# Altium schematic sheet mcu2.SchDoc
size A4; SheetNumber: 3; SheetTotal: 3
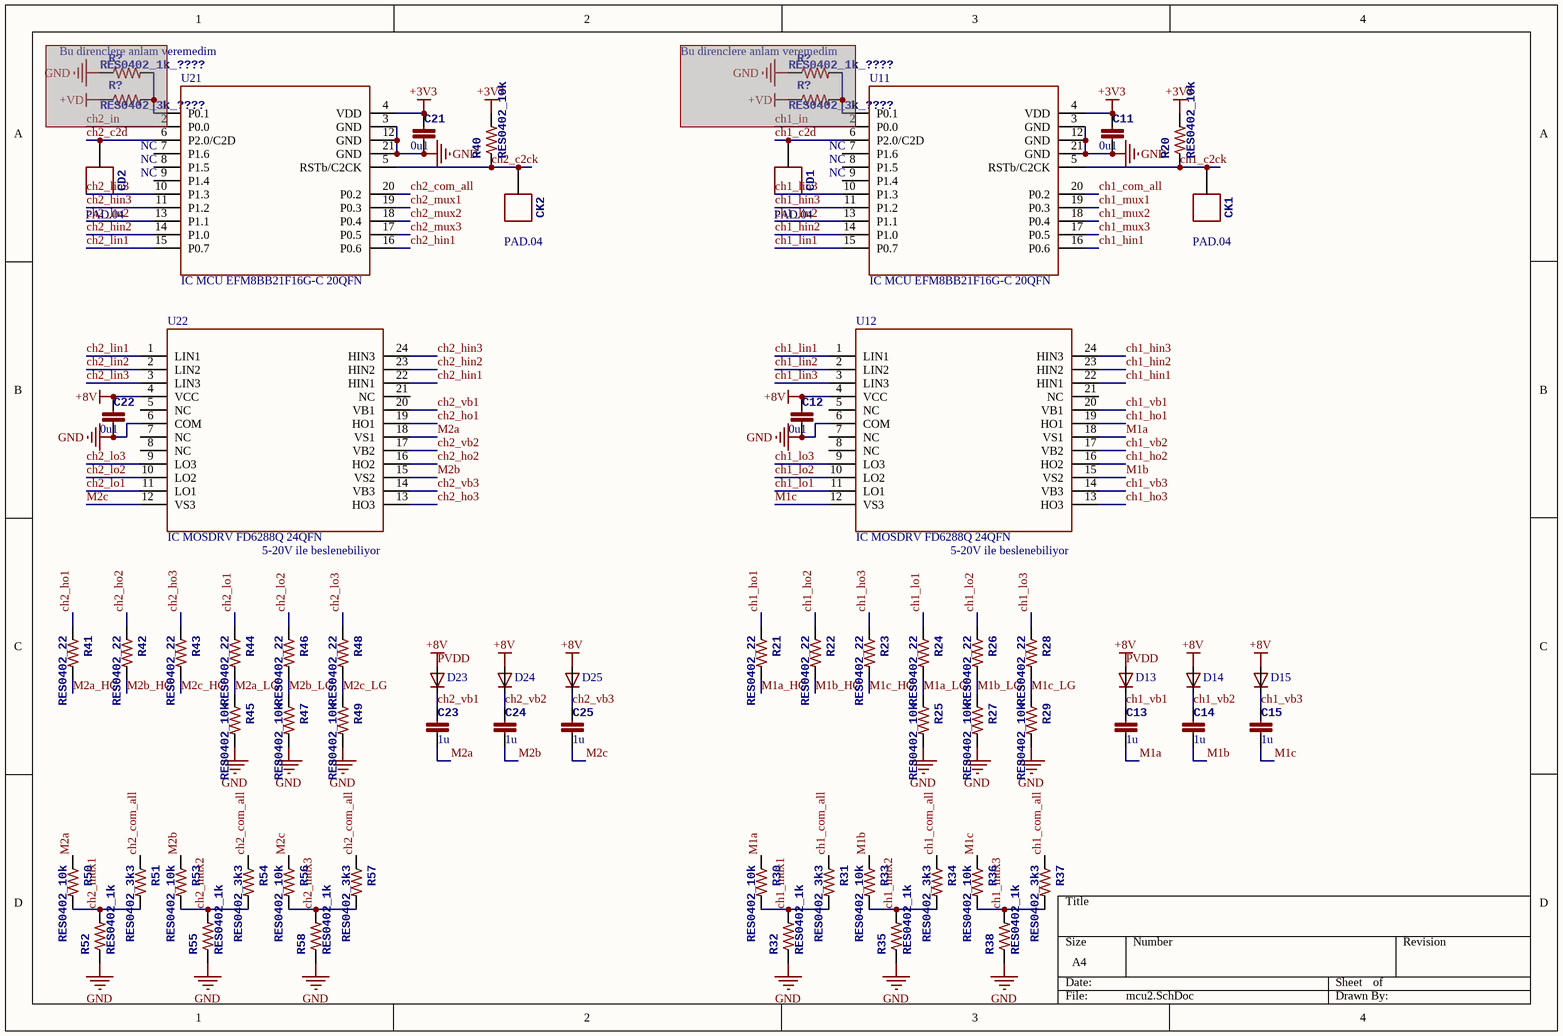
[diagram p0: mcu2.SchDoc]

## Parts
(Parts that share a designator on the sheet are numbered #1, #2 ... from top to bottom, then left to right.)
C11  value 0u1  [0402-CAP]  (hidden comment: CAP0402_0u1_16V_X7R)
C12  value 0u1  [0402-CAP]  (hidden comment: CAP0402_0u1_16V_X7R)
C13  value 1u  [0402-CAP]  (hidden comment: CAP0402_1u_16V_X5R)
C14  value 1u  [0402-CAP]  (hidden comment: CAP0402_1u_16V_X5R)
C15  value 1u  [0402-CAP]  (hidden comment: CAP0402_1u_16V_X5R)
C21  value 0u1  [0402-CAP]  (hidden comment: CAP0402_0u1_16V_X7R)
C22  value 0u1  [0402-CAP]  (hidden comment: CAP0402_0u1_16V_X7R)
C23  value 1u  [0402-CAP]  (hidden comment: CAP0402_1u_16V_X5R)
C24  value 1u  [0402-CAP]  (hidden comment: CAP0402_1u_16V_X5R)
C25  value 1u  [0402-CAP]  (hidden comment: CAP0402_1u_16V_X5R)
CD1  PAD.04  [PAD.04X.04]  (no BOM)
CD2  PAD.04  [PAD.04X.04]  (no BOM)
CK1  PAD.04  [PAD.04X.04]  (no BOM)
CK2  PAD.04  [PAD.04X.04]  (no BOM)
D13  DPWR_1N4148WT  [SOD-523_0P9X1P3]  (value not drawn)
D14  DPWR_1N4148WT  [SOD-523_0P9X1P3]  (value not drawn)
D15  DPWR_1N4148WT  [SOD-523_0P9X1P3]  (value not drawn)
D23  DPWR_1N4148WT  [SOD-523_0P9X1P3]  (value not drawn)
D24  DPWR_1N4148WT  [SOD-523_0P9X1P3]  (value not drawn)
D25  DPWR_1N4148WT  [SOD-523_0P9X1P3]  (value not drawn)
R20  RES0402_10k  [0402-RES]
R21  RES0402_22  [0402-RES]
R22  RES0402_22  [0402-RES]
R23  RES0402_22  [0402-RES]
R24  RES0402_22  [0402-RES]
R25  RES0402_10k  [0402-RES]
R26  RES0402_22  [0402-RES]
R27  RES0402_10k  [0402-RES]
R28  RES0402_22  [0402-RES]
R29  RES0402_10k  [0402-RES]
R30  RES0402_10k  [0402-RES]
R31  RES0402_3k3  [0402-RES]
R32  RES0402_1k  [0402-RES]
R33  RES0402_10k  [0402-RES]
R34  RES0402_3k3  [0402-RES]
R35  RES0402_1k  [0402-RES]
R36  RES0402_10k  [0402-RES]
R37  RES0402_3k3  [0402-RES]
R38  RES0402_1k  [0402-RES]
R40  RES0402_10k  [0402-RES]
R41  RES0402_22  [0402-RES]
R42  RES0402_22  [0402-RES]
R43  RES0402_22  [0402-RES]
R44  RES0402_22  [0402-RES]
R45  RES0402_10k  [0402-RES]
R46  RES0402_22  [0402-RES]
R47  RES0402_10k  [0402-RES]
R48  RES0402_22  [0402-RES]
R49  RES0402_10k  [0402-RES]
R50  RES0402_10k  [0402-RES]
R51  RES0402_3k3  [0402-RES]
R52  RES0402_1k  [0402-RES]
R53  RES0402_10k  [0402-RES]
R54  RES0402_3k3  [0402-RES]
R55  RES0402_1k  [0402-RES]
R56  RES0402_10k  [0402-RES]
R57  RES0402_3k3  [0402-RES]
R58  RES0402_1k  [0402-RES]
R?#1  RES0402_1k_????  [0402-RES]  (masked out: inside a compile mask, not in the netlist)
R?#2  RES0402_1k_????  [0402-RES]  (masked out: inside a compile mask, not in the netlist)
R?#3  RES0402_3k_????  [0402-RES]  (masked out: inside a compile mask, not in the netlist)
R?#4  RES0402_3k_????  [0402-RES]  (masked out: inside a compile mask, not in the netlist)
U11  IC MCU EFM8BB21F16G-C 20QFN  [QFN20_3X3_SIL]
U12  IC MOSDRV FD6288Q 24QFN  [QFN-24(4x4)]
U21  IC MCU EFM8BB21F16G-C 20QFN  [QFN20_3X3_SIL]
U22  IC MOSDRV FD6288Q 24QFN  [QFN-24(4x4)]

## Nets
+3V3: C11.P$1 C21.P$1 R20.P$2 R40.P$2 U11.4(VDD) U21.4(VDD)
GND: C11.P$2 C12.P$2 C21.P$2 C22.P$2 R25.P$2 R27.P$2 R29.P$2 R32.P$1 R35.P$1 R38.P$1 R45.P$2 R47.P$2 R49.P$2 R52.P$1 R55.P$1 R58.P$1 U11.3(GND) U11.12(GND) U11.21(GND) U12.6(COM) U21.3(GND) U21.12(GND) U21.21(GND) U22.6(COM)
PVDD: C12.P$1 C22.P$1 D13.A D14.A D15.A D23.A D24.A D25.A U12.4(VCC) U22.4(VCC)  [also labelled +8V]
ch1_c2ck: CK1.P$1 R20.P$1 U11.5(RSTb/C2CK)
ch1_c2d: CD1.P$1 U11.6(P2.0/C2D)
ch1_com_all: R31.P$1 R34.P$1 R37.P$1 U11.20(P0.2)
ch1_hin1: U11.16(P0.6) U12.22(HIN1)
ch1_hin2: U11.14(P1.0) U12.23(HIN2)
ch1_hin3: U11.11(P1.2) U12.24(HIN3)
ch1_ho1: R21.P$1 U12.19(HO1)
ch1_ho2: R22.P$1 U12.16(HO2)
ch1_ho3: R23.P$1 U12.13(HO3)
ch1_lin1: U11.15(P0.7) U12.1(LIN1)
ch1_lin2: U11.13(P1.1) U12.2(LIN2)
ch1_lin3: U11.10(P1.3) U12.3(LIN3)
ch1_lo1: R24.P$1 U12.11(LO1)
ch1_lo2: R26.P$1 U12.10(LO2)
ch1_lo3: R28.P$1 U12.9(LO3)
ch1_mux1: R30.P$2 R31.P$2 R32.P$2 U11.19(P0.3)
ch1_mux2: R33.P$2 R34.P$2 R35.P$2 U11.18(P0.4)
ch1_mux3: R36.P$2 R37.P$2 R38.P$2 U11.17(P0.5)
ch1_vb1: C13.P$1 D13.K U12.20(VB1)
ch1_vb2: C14.P$1 D14.K U12.17(VB2)
ch1_vb3: C15.P$1 D15.K U12.14(VB3)
ch2_c2ck: CK2.P$1 R40.P$1 U21.5(RSTb/C2CK)
ch2_c2d: CD2.P$1 U21.6(P2.0/C2D)
ch2_com_all: R51.P$1 R54.P$1 R57.P$1 U21.20(P0.2)
ch2_hin1: U21.16(P0.6) U22.22(HIN1)
ch2_hin2: U21.14(P1.0) U22.23(HIN2)
ch2_hin3: U21.11(P1.2) U22.24(HIN3)
ch2_ho1: R41.P$1 U22.19(HO1)
ch2_ho2: R42.P$1 U22.16(HO2)
ch2_ho3: R43.P$1 U22.13(HO3)
ch2_lin1: U21.15(P0.7) U22.1(LIN1)
ch2_lin2: U21.13(P1.1) U22.2(LIN2)
ch2_lin3: U21.10(P1.3) U22.3(LIN3)
ch2_lo1: R44.P$1 U22.11(LO1)
ch2_lo2: R46.P$1 U22.10(LO2)
ch2_lo3: R48.P$1 U22.9(LO3)
ch2_mux1: R50.P$2 R51.P$2 R52.P$2 U21.19(P0.3)
ch2_mux2: R53.P$2 R54.P$2 R55.P$2 U21.18(P0.4)
ch2_mux3: R56.P$2 R57.P$2 R58.P$2 U21.17(P0.5)
ch2_vb1: C23.P$1 D23.K U22.20(VB1)
ch2_vb2: C24.P$1 D24.K U22.17(VB2)
ch2_vb3: C25.P$1 D25.K U22.14(VB3)
M1a: C13.P$2 R30.P$1 U12.18(VS1)
M1a_HG: R21.P$2
M1a_LG: R24.P$2 R25.P$1
M1b: C14.P$2 R33.P$1 U12.15(VS2)
M1b_HG: R22.P$2
M1b_LG: R26.P$2 R27.P$1
M1c: C15.P$2 R36.P$1 U12.12(VS3)
M1c_HG: R23.P$2
M1c_LG: R28.P$2 R29.P$1
M2a: C23.P$2 R50.P$1 U22.18(VS1)
M2a_HG: R41.P$2
M2a_LG: R44.P$2 R45.P$1
M2b: C24.P$2 R53.P$1 U22.15(VS2)
M2b_HG: R42.P$2
M2b_LG: R46.P$2 R47.P$1
M2c: C25.P$2 R56.P$1 U22.12(VS3)
M2c_HG: R43.P$2
M2c_LG: R48.P$2 R49.P$1

Not connected (* = marked no-connect by the designer): U11 1(P0.1) 2(P0.0) 7(P1.6) 8(P1.5) 9(P1.4); U12 5(NC) 7(NC) 8(NC) 21(NC); U21 1(P0.1) 2(P0.0) 7(P1.6) 8(P1.5) 9(P1.4); U22 5(NC) 7(NC) 8(NC) 21(NC)

## Notes on the sheet
- (near R?#1) Bu direnclere anlam veremedim
- (near R?#2) Bu direnclere anlam veremedim
- NC
- (near U22) 5-20V ile beslenebiliyor
- (near U12) 5-20V ile beslenebiliyor

## Library data of the parts
C11 C12 C21 C22 = CAP0402_0u1_16V_X7R: X7R 100nF 16V ±10% 0402 Multilayer Ceramic Capacitors MLCC - SMD/SMT ROHS; Manufacturer Product Number: CL05B104KO3LNNC; LSCS Part Number: C1525; Voltage Rating: 16; Digikey Part Number: 1276-1507-1-ND; Package: 0402
C13-C15 C23-C25 = CAP0402_1u_16V_X5R: X5R 1uF 16V ±10% 0402 Multilayer Ceramic Capacitors MLCC - SMD/SMT ROHS; Manufacturer Product Number: CL05A105KO5NNNC; LSCS Part Number: C29266; Digikey Part Number: 1276-1067-1-ND; Package: 0402; Voltage Rating: 16V
CD1 CD2 CK1 CK2 = X PADS.04
D13-D15 D23-D25 = DPWR_1N4148WT: 75V Independent Type 1.25V@150mA 4ns 150mA SOD-523 Switching Diodes ROHS; LSCS Part Number: C917006; Manufacturer Product Number: 1N4148WT; Package: SOD523; Digikey Part Number: 1N4148WTCT-ND
R20 R25 R27 R29 R30 R33 R36 R40 R45 R47 R49 R50 R53 R56 = RES0402_10k: 50V Thick Film Resistors 62.5mW 110kΩ ±1% ±100ppm/℃ 0402 Chip Resistor - Surface Mount ROHS; Manufacturer Product Number: RC0402FR-0710KL; LSCS Part Number: C60490; Value: 10k; Package: 0402; Digikey Part Number: 311-10.0KLRCT-ND
R21-R24 R26 R28 R41-R44 R46 R48 = RES0402_22: 62.5mW Thick Film Resistors 50V ±1% ±100ppm/℃ 22Ω 0402 Chip Resistor - Surface Mount ROHS; Manufacturer Product Number: RC0402FR-0722RL; LSCS Part Number: C114765; Value: 22; Package: 0402; Digikey Part Number: 311-22.0LRCT-ND
R31 R34 R37 R51 R54 R57 = RES0402_3k3: 62.5mW Thick Film Resistors 50V ±100ppm/℃ ±1% 3.3kΩ 0402 Chip Resistor - Surface Mount ROHS; Manufacturer Product Number: RC0402FR-073K3L; LSCS Part Number: C137992; Value: 3k3; Package: 0402; Digikey Part Number: 1712-CRG0402F3K3CT-ND
R32 R35 R38 R52 R55 R58 = RES0402_1k: 62.5mW Thick Film Resistors 50V ±100ppm/℃ ±1% 1kΩ 0402 Chip Resistor - Surface Mount ROHS; Manufacturer Product Number: RC0402JR-071KL; LSCS Part Number: C105637; Value: 1k; Package: 0402; Digikey Part Number: 311-1.0KJRCT-ND
R?#1 R?#2 = RES0402_1k_????: Value: 1k; Supplier Part Number 1: *; Manufacturer Product Number: *; Supplier Part Number 2: *; Package: 0402
R?#3 R?#4 = RES0402_3k_????: Value: 3k; Supplier Part Number 1: *; Manufacturer Product Number: *; Supplier Part Number 2: *; Package: 0402
U11 U21 = IC MCU EFM8BB21F16G-C 20QFN: IC MCU 8BIT 16KB FLASH 20QFN; LSCS Part Number: C80713; Manufacturer Product Number: EFM8BB21F16G-C-QFN20R; Digikey Part Number: 336-4743-1-ND; Package: 20QFN
U12 U22 = IC MOSDRV FD6288Q 24QFN: High and low sides MOSFET 1.8A 8V~20V 1.5A QFN-24 Gate Drivers ROHS; LSCS Part Number: C328453; Digikey Part Number: N/A; Package: 24QFN(4x4); Manufacturer Product Number: FD6288Q